# Altium schematic sheet Schematic v1.SchDoc
size 381 x 241 mm; SheetNumber: 1; SheetTotal: 1
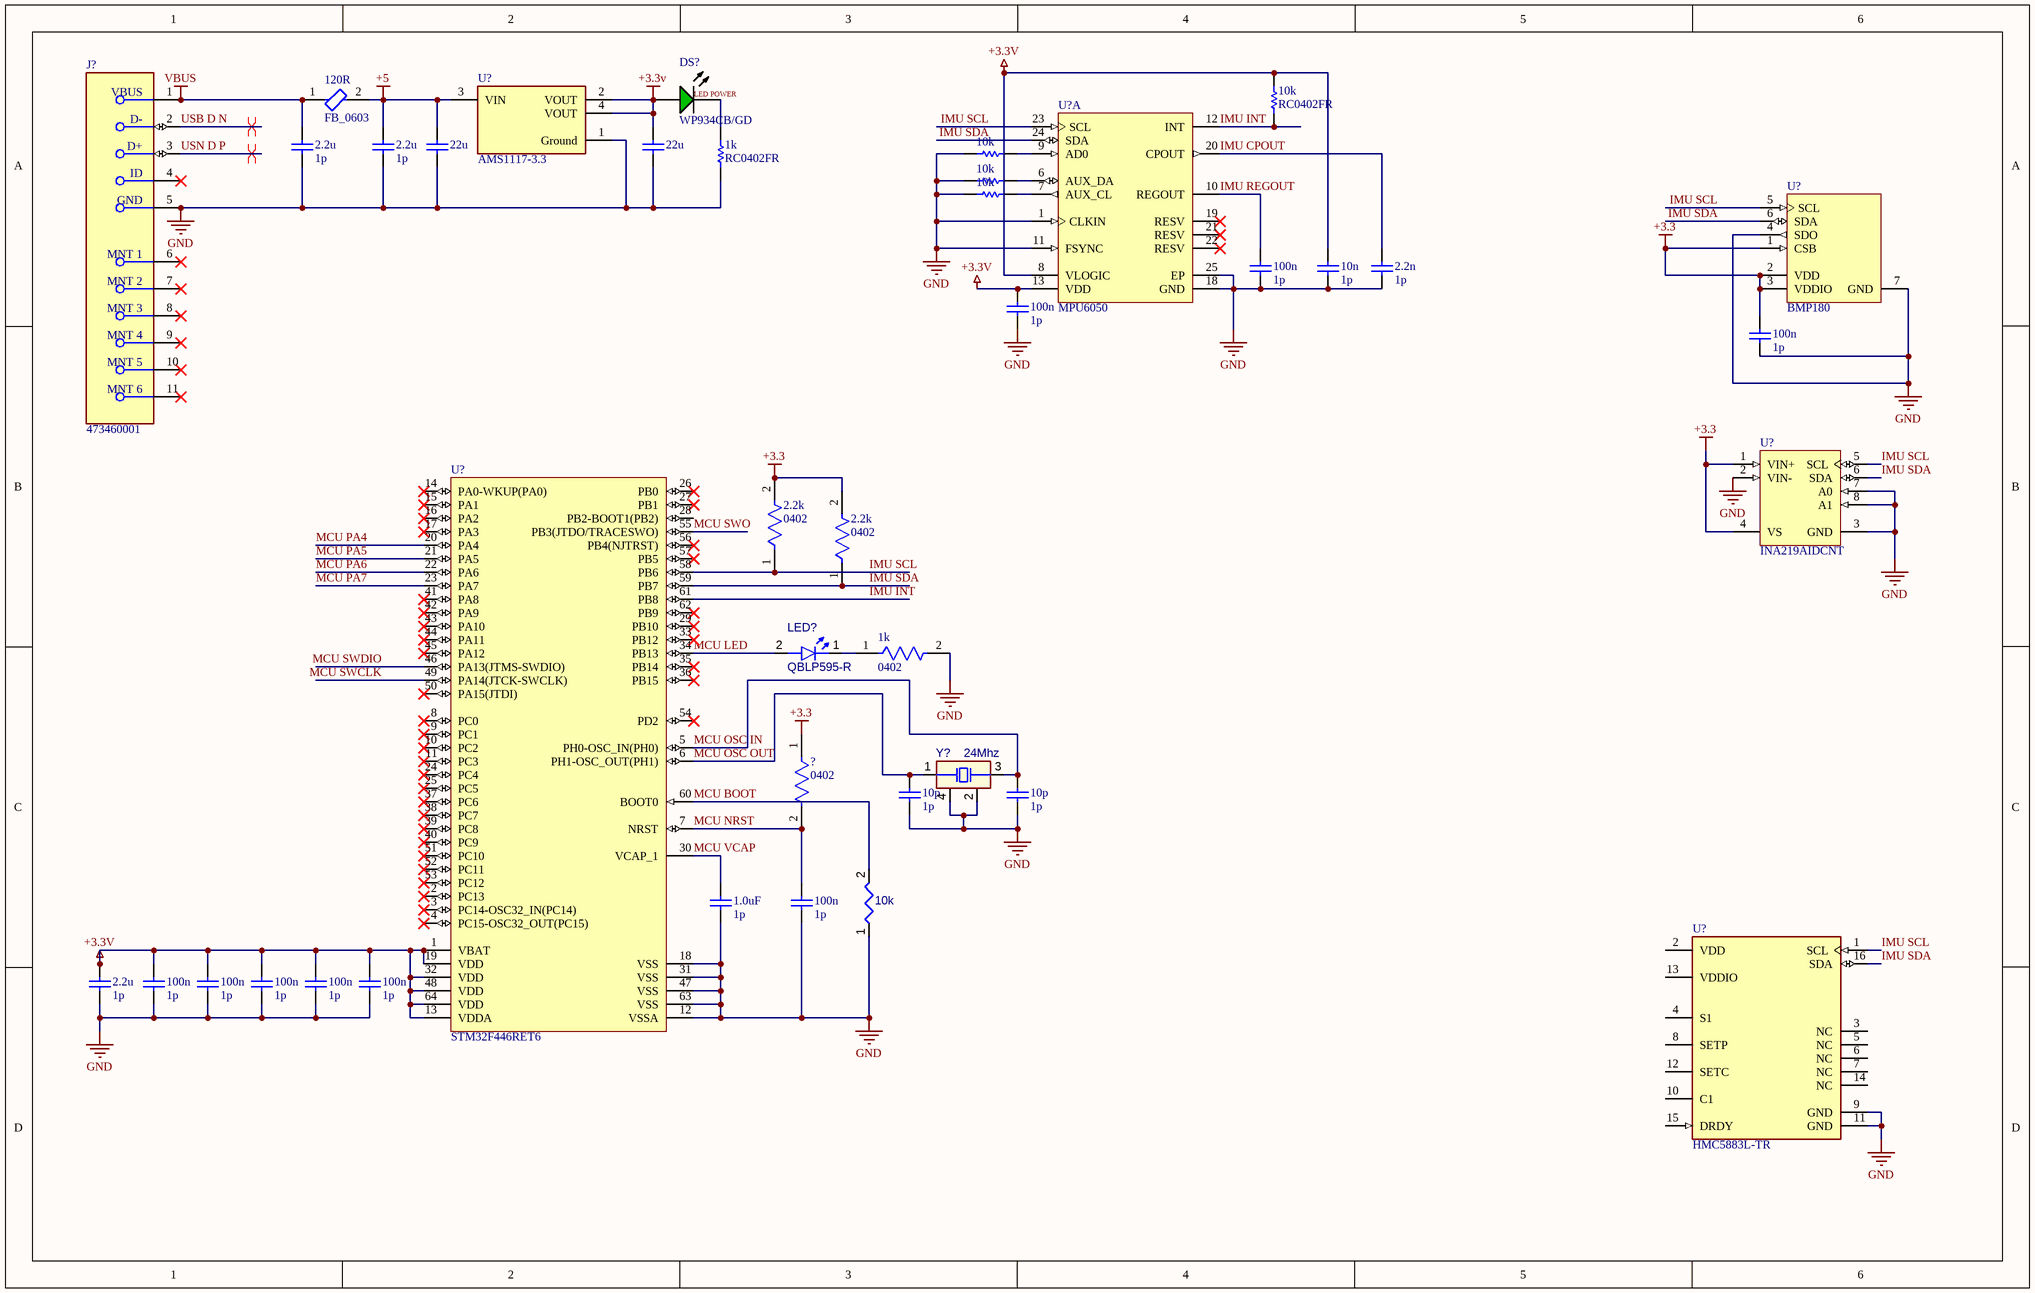
[diagram p0: Schematic v1.SchDoc]

## Parts
(Parts that share a designator on the sheet are numbered #1, #2 ... from top to bottom, then left to right.)
1.0uF  value 1p  (hidden comment: Ceramic)
1k#1  RC0402FR  [RESC1005X40X25LL05T10]
1k#2  0402  [FP-AC0402-IPC_A]
2.2k#1  0402  [FP-AC0402-IPC_A]
2.2k#2  0402  [FP-AC0402-IPC_A]
2.2n  value 1p  (hidden comment: Capacitor)
2.2u#1  value 1p  (hidden comment: Capacitor)
2.2u#2  value 1p  (hidden comment: Capacitor)
2.2u#3  value 1p  (hidden comment: Capacitor)
10k#1  RC0402FR  [RESC1005X40X25LL05T10]
10k#2  (no value)  [RESC1005X40X25LL05T10]
10k#3  (no value)  [RESC1005X40X25LL05T10]
10k#4  (no value)  [RESC1005X40X25LL05T10]
10k#5  Resistors  (value not drawn)
10n  value 1p  (hidden comment: Capacitor)
10p#1  value 1p  (hidden comment: Capacitor)
10p#2  value 1p  (hidden comment: Capacitor)
22u#1  (no value)  [CAPC2013X140X50NL20T25]
22u#2  (no value)  [CAPC2013X140X50NL20T25]
100n#1  value 1p  (hidden comment: Capacitor)
100n#2  value 1p  (hidden comment: Capacitor)
100n#3  value 1p  (hidden comment: Capacitor)
100n#4  value 1p  (hidden comment: 100n)
100n#5  value 1p  (hidden comment: Capacitor)
100n#6  value 1p  (hidden comment: Capacitor)
100n#7  value 1p  (hidden comment: Capacitor)
100n#8  value 1p  (hidden comment: Capacitor)
100n#9  value 1p  (hidden comment: Capacitor)
120R  FB_0603  [FP-BLM15-0_05-IPC_B]
?  0402  [FP-AC0402-IPC_A]
DS?  WP934CB/GD  [KING-WP934CBGD_V]
J?  473460001  [FP-473460001-MFG]
LED?  QBLP595-R  [QTB-QBLP595_V]
U?#1  AMS1117-3.3  [FP-AMS1117-IPC_C]
U?#2  MPU6050  [INSE-QFN-24_V]  (part A of 2)
U?#3  BMP180  [BOSC-BMP180-7_V]
U?#4  INA219AIDCNT  [DCN0008A_L]
U?#5  STM32F446RET6  [STM-LQFP64_L]
U?#6  HMC5883L-TR  [FP-HMC5883L-TR-MFG]
Y?  24Mhz  [EPSON-FA-128_V]

## Nets
+3.3: 2.2k#1.2 2.2k#2.2 100n#3.1 ?.1 U?#3.1(CSB) U?#3.2(VDD) U?#3.3(VDDIO) U?#4.1(VIN+) U?#4.4(VS)
+3.3V: 2.2u#3.1 10k#1.2 10n.1 22u#2.2 100n#2.1 100n#5.1 100n#6.1 100n#7.1 100n#8.1 100n#9.1 DS?.2(A) U?#1.2(VOUT) U?#1.4(VOUT) U?#2.8(VLOGIC) U?#2.13(VDD) U?#5.1(VBAT) U?#5.13(VDDA) U?#5.19(VDD) U?#5.32(VDD) U?#5.48(VDD) U?#5.64(VDD)
+5: 2.2u#2.1 22u#1.2 120R.2 U?#1.3(VIN)
GND: 1.0uF.1 1k#1.1 1k#2.2 2.2n.2 2.2u#1.2 2.2u#2.2 2.2u#3.2 10k#2.2 10k#3.2 10k#4.2 10k#5.1 10n.2 10p#1.2 10p#2.2 22u#1.1 22u#2.1 100n#1.2 100n#2.2 100n#3.2 100n#4.1 100n#5.2 100n#6.2 100n#7.2 100n#8.2 100n#9.2 J?.5(GND) U?#1.1(Ground) U?#2.1(CLKIN) U?#2.11(FSYNC) U?#2.18(GND) U?#2.25(EP) U?#3.4(SDO) U?#3.7(GND) U?#4.2(VIN-) U?#4.3(GND) U?#4.7(A0) U?#4.8(A1) U?#5.12(VSSA) U?#5.18(VSS) U?#5.31(VSS) U?#5.47(VSS) U?#5.63(VSS) U?#6.9(GND) U?#6.11(GND) Y?.2(NC) Y?.4(NC)
VBUS: 2.2u#1.1 120R.1 J?.1(VBUS)
IMU CPOUT: 2.2n.1 U?#2.20(CPOUT)
IMU INT: 10k#1.1 U?#2.12(INT) U?#5.61(PB8)
IMU REGOUT: 100n#1.1 U?#2.10(REGOUT)
IMU SCL: 2.2k#1.1 U?#2.23(SCL) U?#3.5(SCL) U?#4.5(SCL) U?#5.58(PB6) U?#6.1(SCL)
IMU SDA: 2.2k#2.1 U?#2.24(SDA) U?#3.6(SDA) U?#4.6(SDA) U?#5.59(PB7) U?#6.16(SDA)
MCU BOOT: 10k#5.2 U?#5.60(BOOT0)
MCU LED: LED?.2(A) U?#5.34(PB13)
MCU NRST: 100n#4.2 ?.2 U?#5.7(NRST)
MCU OSC IN: 10p#2.1 U?#5.5(PH0-OSC_IN(PH0)) Y?.3(X2)
MCU OSC OUT: 10p#1.1 U?#5.6(PH1-OSC_OUT(PH1)) Y?.1(X1)
MCU PA4: U?#5.20(PA4)
MCU PA5: U?#5.21(PA5)
MCU PA6: U?#5.22(PA6)
MCU PA7: U?#5.23(PA7)
MCU SWCLK: U?#5.49(PA14(JTCK-SWCLK))
MCU SWDIO: U?#5.46(PA13(JTMS-SWDIO))
MCU SWO: U?#5.55(PB3(JTDO/TRACESWO))
MCU VCAP: 1.0uF.2 U?#5.30(VCAP_1)
USB D N: J?.2(D-)
USN D P: J?.3(D+)
Net1k#1_2: 1k#1.2 DS?.1(K)
Net1k#2_1: 1k#2.1 LED?.1(K)
Net10k#2_1: 10k#2.1 U?#2.9(AD0)
Net10k#3_1: 10k#3.1 U?#2.6(AUX_DA)
Net10k#4_1: 10k#4.1 U?#2.7(AUX_CL)

Not connected (* = marked no-connect by the designer): J? 4(ID)* 6(MNT_1)* 7(MNT_2)* 8(MNT_3)* 9(MNT_4)* 10(MNT_5)* 11(MNT_6)*; U?#2 19(RESV)* 21(RESV)* 22(RESV)*; U?#5 2(PC13)* 3(PC14-OSC32_IN(PC14))* 4(PC15-OSC32_OUT(PC15))* 8(PC0)* 9(PC1)* 10(PC2)* 11(PC3)* 14(PA0-WKUP(PA0))* 15(PA1)* 16(PA2)* 17(PA3)* 24(PC4)* 25(PC5)* 26(PB0)* 27(PB1)* 28(PB2-BOOT1(PB2)) 29(PB10)* 33(PB12)* 35(PB14)* 36(PB15)* 37(PC6)* 38(PC7)* 39(PC8)* 40(PC9)* 41(PA8)* 42(PA9)* 43(PA10)* 44(PA11)* 45(PA12)* 50(PA15(JTDI))* 51(PC10)* 52(PC11)* 53(PC12)* 54(PD2)* 56(PB4(NJTRST))* 57(PB5)* 62(PB9)*; U?#6 2(VDD) 3(NC) 4(S1) 5(NC) 6(NC) 7(NC) 8(SETP) 10(C1) 12(SETC) 13(VDDIO) 14(NC) 15(DRDY)

## Layout directives
differential pair: USB D N, USN D P

## Notes on the sheet
- Labels drawn without touching a wire or pin: LED POWER

## Library data of the parts
1.0uF 100n#4 = Capacitor: v-Cap-1; SimulationGenericComponent: True
1k#1 10k#1-10k#4 = CMP-2002-07902-1: Part Number: RC0402FR-1368RL; Manufacturer: Yageo
1k#2 2.2k#1 2.2k#2 ? = CMP-03412-007717-2: RES 10.7kΩ ±0.5% 0.063W 0402; RoHS Compliant: Yes
2.2n 2.2u#1-2.2u#3 10n 10p#1 10p#2 100n#1-100n#3 100n#5-100n#9 = Capacitor: SimulationGenericComponent: True
10k#5 = Resistors: Resistor; Component Type: Resistors
22u#1 22u#2 = CMP-2007-03253-1: Manufacturer: Kemet; Part Number: C0805C185K4RACTU
120R = CMP-06046-001000-1: Chip Ferrite Bead, 0402, 1800Ω @ 100MHz, 2.2Ω, 25%, 200mA; DC Resistance (DCR): 2.2R; Number of Lines: 1; Case/Package: 0402; Mount: Surface Mount; Packaging: Cut Tape; Ratings: AEC-Q200; Max Current Rating: 200mA; Min Operating Temperature: -55°C; Max Operating Temperature: 125°C
DS? = CMP-2000-07417-1: Right Angle LED Indicator, 62.5 mW, 25 mA, -40 to 85 degC, 2-Pin THD, RoHS, Bulk; Manufacturer: Kingbright; Voltage Rating: 2.2V; Configuration: Single; Other Names: 754-1297 / WP934CBGD; Lens Style/Size: RoundwithDomedTop,3mm; Catalog Drawings: WP934CBSeriesFront / WP934CBSeriesSide; Millicandela Rating: 22.5mcd; Minimum Quantity: Green; 3D Model: WP934CB/x.sldprt / WP934CB/x.pro / WP934CB/x.igs / WP934CB/x.stp; Wavelength - Peak: 568nm; Lens Type: Diffused,Tinted; Dynamic Catalog: SingleLevel3mm(T1)SingleColorRightAngleLEDs; Viewing Angle: 40°; Current: 20mA; Packaging: Bulk; Package Reference: WP934CBGD; Datasheet Version: Rev. 10B, 09/2016; Family: LEDs-CircuitBoardIndicators,Arrays,LightBars,BarGraphs; Manufacturer URL: http://www.kingbright.com/; Standard Package: 500; Mounting Technology: ThroughHole; Quantity Available: Bulk; Category: Optoelectronics; Color: Green; Package Description: 2-Pin Through Hole Device, Body 4.6 x 8.75 mm; Mounting Type: ThroughHole,RightAngle; Datasheet URL: http://www.kingbrightusa.com/images/catalog/SPEC/WP934CB-GD.pdf
J? = CMP-2000-05246-2: CONN RCPT USB2.0 MICRO B SMD R/A; Manufacturer: Molex; Conn Orientation: Right Angle; Is Female: yes; Shielding: true; Pitch: 0.65mm; Number Of Contacts: 5; Voltage Rating: 30V; Current Rating: 1.8A; Device Class L2: USB Connectors; Digikey Description: CONN RCPT USB2.0 MICRO B SMD R/A; Height: 2.945mm; RoHS: TRUE; ComponentLink2Description: Datasheet; Octopart: https://octopart.com/47346-0001-molex-7164928; Automotive: No; Package: 0; Category: Conn; Device Class L1: Connectors; Usb Standard: USB 2.0; Temperature: -30°C to +85°C; Temperature Range Low: -30°C; Footprint Url: https://www.molex.com/pdm_docs/sd/473460001_sd.pdf; ComponentLink2URL: https://www.molex.com/webdocs/datasheets/pdf/en-us/0473460001_IO_CONNECTORS.pdf; Lead Free: Yes; Manufacturer Part Number: 473460001; Contact Material: Gold,Nickel; Temperature Range High: +85°C; Device Class L3: unset
LED? = CMP-007-00040-3: Chip LED 0402, Red, 0.02 A, 2.0 to 2.5 V, -40 to 80 degC, 2-Pin SMD, RoHS, Tape and Reel; Colour: Red; RoHS Compliant: Yes; Case/Package: 0402; Pins: 2; Mounting Technology: SMT
U?#1 = CMP-209535-000001-1: LDO Voltage Regulators 1A, 3.3V; Manufacturer: Advanced Monolithic Systems; Dropout Voltage: 1.1V; Output Type: Fixed; Nominal Supply Current: 5mA; Max Power Dissipation: 1.2W; Max Supply Voltage: 15V; Number Of Outputs: 1; Standoff Height: 0.64mm; Max Junction Temp: +125°C; Height: 1.8mm; Package: AMS1117; Device Class L2: Power Management ICs; ComponentLink2Description: Datasheet; ComponentLink2URL: http://www.advanced-monolithic.com/pdf/ds1117.pdf; Category: IC; RoHS: TRUE; Automotive: No; Device Class L1: Integrated Circuits (ICs); Output Current: 1A; Device Class L3: Voltage Regulators - Linear; Temperature: -40°C to +125°C; Output Voltage: 3.3V; Manufacturer Part Number: AMS1117-3.3; Temperature Range Low: -40°C; Octopart: https://octopart.com/ams1117-3.3-advanced+monolithic+systems-25899300; Lead Free: Yes; Ipc Land Pattern Name: SOT229P700X180-4; Temperature Range High: +125°C
U?#2 = CMP-010-00014-3: 3-Axis Gyroscope, 3-Axis Accelerometer, 2.375 to 3.46 V, -40 to 105 degC, 24-Pin QFN, RoHS, Tape and Reel; Manufacturer: InvenSense; Max Supply Voltage: 3.6V; Min Supply Voltage: 2.5V; Sensor Type: Motion; Interface: I2C; Min Operating Temperature: -40°C; Case/Package: QFN; Package Quantity: 5000; Pins: 24; RoHS Compliant: True; Packaging: CutTape; Datasheet URL: https://datasheet.ciiva.com/1513/1788002-1513632.pdf; Package Reference: QFN-24; Datasheet Version: Rev. 3.4, 08/2013; Package Description: 24-Pin Quad Flat No-lead Package, Body 4 x 4 mm, Pitch 0.5 mm; Max Operating Temperature: 85°C; Mounting Technology: SM
U?#3 = CMP-2000-05074-1: Digital Pressure Sensor, 1.8 to 3.6 V, -40 to 85 degC, 7-Pin LGA, RoHS; Manufacturer: Bosch Sensortec; Output Type: I²C; Other Names: 0273.300.244-1NV / 828-1027-2; Pressure Type: Absolute; Maximum Pressure: 145.04PSI(1000kPa); Voltage - Supply: 1.62V~3.6V; EDA / CAD Models: DownloadfromAcceleratedDesigns; Accuracy: ±2%; Port Style: NoPort; For Use With: 1528-1434-ND / -BMP180BAROMETRICPRESS/TEMP5V / 1528-1435-ND / -L3GD20HLSM303BMP18010DOFIMU / 1568-1260-ND / -SPARKFUNBAROMETRICPRESSURESEN / 1597-1301-ND / -GROVEBAROMETERSENSOR / 1597-1302-ND / -GROVEIMU10DOF / 1471-1581-ND / -10DOFCLICK / 101040003-ND / -XADOWBAROMETERBMP180V1.0 / 101040004-ND / -XADOW-IMU10DOF / 114990245-ND / -BOARDTPHPRESSURETEMPREV.4 / 828-1028-ND / -BMP180SHUTTLEBOARDFORDEVKIT / 103990031-ND / -TPHBOARDTHETEMPERATUREPRESSU; Operating Pressure: 4.35PSI~15.95PSI(30kPa~110kPa); Output: 16~19b; Supplier Device Package: 7-LGA; Operating Temperature: -40degC~85degC; Standard Package: 5,000; Package / Case: 7-VLGA; Manufacturer URL: http://www.bosch-sensortec.com; Category: Sensors,Transducers; Datasheet URL: http://media.digikey.com/pdf/Data%20Sheets/Bosch/BMP180.pdf; Family: PressureSensors,Transducers; Termination Style: PCB; Datasheet Version: Rev. 2.4, 01/2012
U?#4 = CMP-0704-00039-2: Zero-Drift, Bi-Directional Current / Power Monitor, 3 to 5.5 V, -40 to 125 degC, 8-pin SOT23 (DCN8), Green (RoHS & no Sb/Br); Manufacturer: Texas Instruments; Input Offset (+/-)(Max)(uV): 100; Common Mode Range(Max)(V): 26; Gain(V/V): 1, 0.5, 0.25, 0.125; Vs(Min)(V): 3; Vs(Max)(V): 5.5; Small-Signal Bandwidth(Typ)(MHz): 0.011; Rating: Catalog; SubFamily: Current Shunt Monitor; Common Mode Range(Min)(V): 0; Quiescent Current (+/-)(Typ)(mA): 0.7; Code_JEDEC: MO-178; DatasheetVersion: SBOS448F; ComponentLink3URL: http://www.ti.com/lit/ml/mpds099c/mpds099c.pdf; PackageReference: DCN0008A; Eco-Plan: Green (RoHS & no Sb/Br); PackageVersion: 4202106/D, 11/2009; PackageDescription: 8-Pin Plastic Small Outline, Body 1.6 x 2.9 mm, Pitch 0.65 mm; ComponentLink3Description: Package Specification; ComponentLink1Description: Manufacturer URL; ComponentLink1URL: http://www.ti.com/; CMRR(Min)(dB): 100; Mounting Technology: Surface Mount; ComponentLink2URL: http://www.ti.com/general/docs/lit/getliterature.tsp?genericPartNumber=INA219&fileType=pdf; PartNumber: INA219AIDCNT; ComponentLink2Description: Datasheet
U?#5 = CMP-0243-00218-1: ARM Cortex-M4 32-bit MCU+FPU, 512 KB Flash, 128 KB Internal RAM, 50 I/Os, 64-Pin LQFP, -40 to 85 degC, Tray; I/Os (High Current): 50; Supply Voltage(Vcc) min (V): 1.7; Operating Frequency(F) (Processor speed) (MHz): 180; D/A Converter: 2; Internal RAM Size (kB): 128; FLASH Size (Prog) (kB): 512; Core: ARM Cortex-M4; ComponentLink1Description: Manufacturer URL; Package Reference: 64-Pin Low-profile Quad Flat Package, Body 10 x 10 mm, Pitch 0.5 mm; ComponentLink2URL: http://www.st.com/st-web-ui/static/active/en/resource/technical/document/datasheet/DM00141306.pdf; Packing: Tray; DatasheetVersion: Rev. 6; ComponentLink1URL: http://www.st.com/; ComponentLink2Description: Datasheet; Package Description: LQFP64; Mounting Technology: Surface Mount
U?#6 = CMP-2000-05148-2: SENSOR MR I2C 16LCC; Min Supply Voltage: 2.16V; Operating Supply Current: 100uA; Max Supply Voltage: 3.6V; Operating Supply Voltage: 2.5V; Min Operating Temperature: -30°C; Interface: I2C; Max Operating Temperature: 85°C; Package Quantity: 4000; REACH SVHC: No SVHC; Case/Package: LCC; Packaging: Tape and Reel; Number of Pins: 16; Radiation Hardening: No
Y? = CMP-003-00028-1: Crystal, 24 MHz, +/- 10 ppm, -20 to 75 degC, 4-Pin SMD, RoHS, Tape and Reel; Load Capacitance: 12pF; ESR: 80; Mounting Technology: SMT; Pins: 4; Case/Package: SMD/SMT; Frequency: 24MHz; Min Operating Temperature: -20°C; RoHS Compliant: Yes; Max Operating Temperature: 75°C